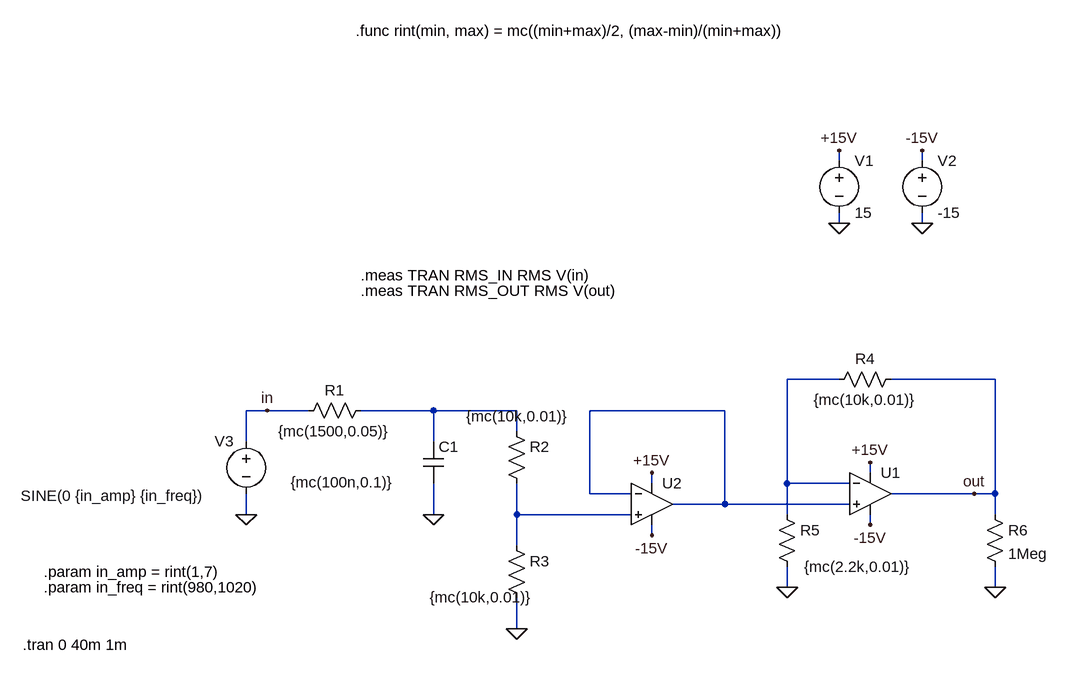
[diagram p0: schematic circuit_test.asc]
circuit_test.asc, the LTspice schematic file:
Version 4.1
SHEET 1 880 912
WIRE 256 -32 256 -48
WIRE 384 -32 384 -48
WIRE 256 64 256 48
WIRE 384 64 384 48
WIRE 256 304 176 304
WIRE 496 304 336 304
WIRE -624 352 -656 352
WIRE -560 352 -624 352
WIRE -368 352 -480 352
WIRE -240 352 -368 352
WIRE 80 352 -128 352
WIRE -240 384 -240 352
WIRE -656 400 -656 352
WIRE -368 400 -368 352
WIRE 304 448 304 432
WIRE -32 464 -32 448
WIRE 176 464 176 304
WIRE 272 464 176 464
WIRE -128 480 -128 352
WIRE -64 480 -128 480
WIRE 464 480 336 480
WIRE 496 480 496 304
WIRE 496 480 464 480
WIRE 80 496 80 352
WIRE 80 496 0 496
WIRE 272 496 80 496
WIRE -656 512 -656 480
WIRE -368 512 -368 464
WIRE -240 512 -240 464
WIRE -64 512 -240 512
WIRE 176 512 176 464
WIRE 496 512 496 480
WIRE 304 528 304 512
WIRE -32 544 -32 528
WIRE -240 560 -240 512
WIRE 176 624 176 592
WIRE 496 624 496 592
WIRE -240 688 -240 640
FLAG 256 64 0
FLAG 384 64 0
FLAG 256 -48 +15V
FLAG 384 -48 -15V
FLAG 304 432 +15V
FLAG 304 528 -15V
FLAG -656 512 0
FLAG -368 512 0
FLAG -240 688 0
FLAG 176 624 0
FLAG -32 448 +15V
FLAG -32 544 -15V
FLAG 496 624 0
FLAG 464 480 out
FLAG -624 352 in
SYMBOL OpAmps\\UniversalOpAmp2 304 480 R0
SYMATTR InstName U1
SYMBOL voltage 256 -48 R0
WINDOW 123 0 0 Left 0
WINDOW 39 0 0 Left 0
SYMATTR InstName V1
SYMATTR Value 15
SYMBOL voltage 384 -48 R0
WINDOW 123 0 0 Left 0
WINDOW 39 0 0 Left 0
SYMATTR InstName V2
SYMATTR Value -15
SYMBOL voltage -656 384 R0
WINDOW 0 -49 15 Left 2
WINDOW 3 -347 99 Left 2
WINDOW 123 0 0 Left 0
WINDOW 39 0 0 Left 0
SYMATTR InstName V3
SYMATTR Value SINE(0 {in_amp} {in_freq})
SYMBOL res -464 336 R90
WINDOW 0 0 56 VBottom 2
WINDOW 3 32 56 VTop 2
SYMATTR InstName R1
SYMATTR Value {mc(1500,0.05)}
SYMBOL cap -384 400 R0
WINDOW 3 -204 62 Left 2
SYMATTR InstName C1
SYMATTR Value {mc(100n,0.1)}
SYMBOL res -256 368 R0
WINDOW 3 -62 -7 Left 2
SYMATTR InstName R2
SYMATTR Value {mc(10k,0.01)}
SYMBOL res -256 544 R0
WINDOW 3 -118 95 Left 2
SYMATTR InstName R3
SYMATTR Value {mc(10k,0.01)}
SYMBOL res 352 288 R90
WINDOW 0 0 56 VBottom 2
WINDOW 3 32 56 VTop 2
SYMATTR InstName R4
SYMATTR Value {mc(10k,0.01)}
SYMBOL res 160 496 R0
WINDOW 3 42 96 Left 2
SYMATTR InstName R5
SYMATTR Value {mc(2.2k,0.01)}
SYMBOL OpAmps\\UniversalOpAmp2 -32 496 R0
SYMATTR InstName U2
SYMBOL res 480 496 R0
SYMATTR InstName R6
SYMATTR Value 1Meg
TEXT -968 600 Left 2 !.param in_amp = rint(1,7)
TEXT -488 -232 Left 2 !.func rint(min, max) = mc((min+max)/2, (max-min)/(min+max))
TEXT -968 624 Left 2 !.param in_freq = rint(980,1020)
TEXT -1000 712 Left 2 !.tran 0 40m 1m
TEXT -480 144 Left 2 !.meas TRAN RMS_IN RMS V(in)
TEXT -480 168 Left 2 !.meas TRAN RMS_OUT RMS V(out)

The netlist it stands for:
* circuit_test.asc
X§U1 N003 N001 +15V -15V out level2 Avol=1Meg GBW=10Meg Slew=10Meg Ilimit=25m Rail=0 Vos=0 En=0 Enk=0 In=0 Ink=0 Rin=500Meg  ; pins In+ In- V+ V- OUT
V1 +15V 0 15
V2 -15V 0 -15
V3 in 0 SINE(0 {in_amp} {in_freq})
R1 N002 in {mc(1500,0.05)}
C1 N002 0 {mc(100n,0.1)}
R2 N002 N004 {mc(10k,0.01)}
R3 N004 0 {mc(10k,0.01)}
R4 out N001 {mc(10k,0.01)}
R5 N001 0 {mc(2.2k,0.01)}
X§U2 N004 N003 +15V -15V N003 level2 Avol=1Meg GBW=10Meg Slew=10Meg Ilimit=25m Rail=0 Vos=0 En=0 Enk=0 In=0 Ink=0 Rin=500Meg  ; pins In+ In- V+ V- OUT
R6 out 0 1Meg
.param in_amp = rint(1,7)
.func rint(min, max) = mc((min+max)/2, (max-min)/(min+max))
.param in_freq = rint(980,1020)
.tran 0 40m 1m
.meas TRAN RMS_IN RMS V(in)
.meas TRAN RMS_OUT RMS V(out)
.lib UniversalOpAmp2.lib
.backanno
.end